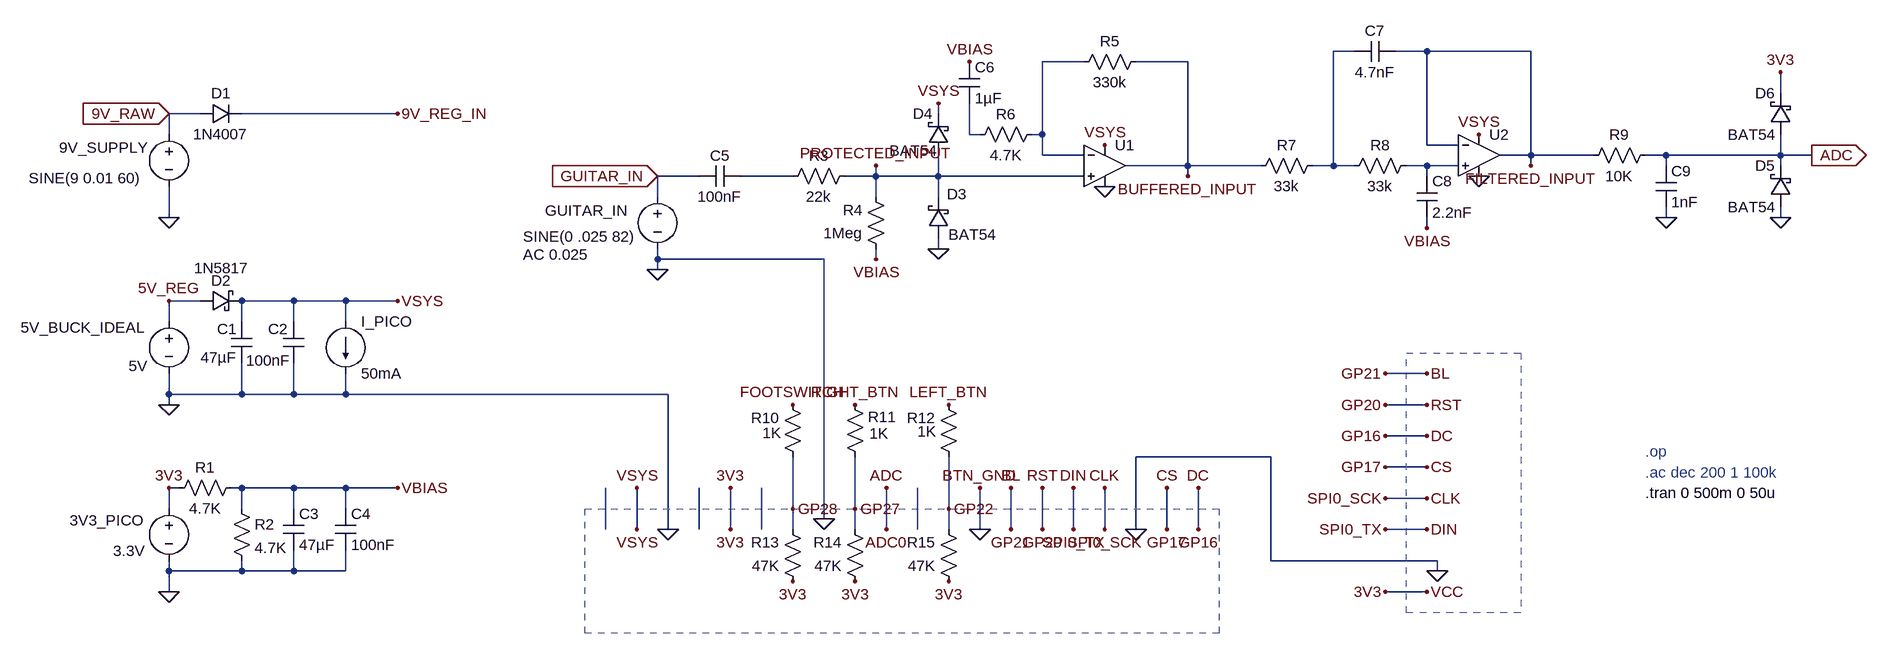
[diagram p0: schematic Tuner_LTspice_Circuit.asc]
Tuner_LTspice_Circuit.asc, the LTspice schematic file:
Version 4
SHEET 1 3036 1332
WIRE 1952 80 1920 80
WIRE 2064 80 2016 80
WIRE 2224 80 2064 80
WIRE 1536 96 1472 96
WIRE 1696 96 1616 96
WIRE 2608 144 2608 112
WIRE 176 176 128 176
WIRE 480 176 240 176
WIRE 1312 176 1312 160
WIRE 128 208 128 176
WIRE 1360 208 1360 160
WIRE 1376 208 1360 208
WIRE 1472 208 1472 96
WIRE 1472 208 1456 208
WIRE 2064 224 2064 80
WIRE 2112 224 2064 224
WIRE 1472 240 1472 208
WIRE 1536 240 1472 240
WIRE 2224 240 2224 80
WIRE 2224 240 2176 240
WIRE 2320 240 2224 240
WIRE 2432 240 2400 240
WIRE 2608 240 2608 208
WIRE 2608 240 2432 240
WIRE 2656 240 2608 240
WIRE 1696 256 1696 96
WIRE 1696 256 1600 256
WIRE 1808 256 1696 256
WIRE 1920 256 1920 80
WIRE 1920 256 1888 256
WIRE 1952 256 1920 256
WIRE 2064 256 2032 256
WIRE 2112 256 2064 256
WIRE 2224 256 2224 240
WIRE 2432 256 2432 240
WIRE 2608 256 2608 240
WIRE 944 272 880 272
WIRE 1088 272 1008 272
WIRE 1216 272 1216 256
WIRE 1216 272 1168 272
WIRE 1312 272 1312 240
WIRE 1312 272 1216 272
WIRE 1536 272 1312 272
WIRE 1696 272 1696 256
WIRE 2064 272 2064 256
WIRE 880 304 880 272
WIRE 1216 304 1216 272
WIRE 1312 304 1312 272
WIRE 128 336 128 288
WIRE 2432 336 2432 320
WIRE 2608 336 2608 320
WIRE 2064 352 2064 336
WIRE 1312 384 1312 368
WIRE 880 400 880 384
WIRE 1136 400 880 400
WIRE 1216 400 1216 384
WIRE 880 416 880 400
WIRE 176 464 128 464
WIRE 320 464 240 464
WIRE 400 464 320 464
WIRE 480 464 400 464
WIRE 128 496 128 464
WIRE 240 496 240 464
WIRE 320 496 320 464
WIRE 400 496 400 464
WIRE 2064 576 2000 576
WIRE 128 608 128 576
WIRE 240 608 240 560
WIRE 240 608 128 608
WIRE 320 608 320 560
WIRE 320 608 240 608
WIRE 400 608 400 576
WIRE 400 608 320 608
WIRE 896 608 400 608
WIRE 128 624 128 608
WIRE 2064 624 2000 624
WIRE 2064 672 2000 672
WIRE 1824 704 1616 704
WIRE 2064 720 2000 720
WIRE 144 752 128 752
WIRE 240 752 224 752
WIRE 320 752 240 752
WIRE 400 752 320 752
WIRE 480 752 400 752
WIRE 2064 768 2000 768
WIRE 128 784 128 752
WIRE 240 784 240 752
WIRE 320 784 320 752
WIRE 400 784 400 752
WIRE 1088 784 1088 704
WIRE 1184 784 1184 704
WIRE 1328 784 1328 704
WIRE 1136 800 1136 400
WIRE 800 816 800 752
WIRE 848 816 848 752
WIRE 896 816 896 608
WIRE 944 816 944 752
WIRE 992 816 992 752
WIRE 1040 816 1040 752
WIRE 1088 816 1088 784
WIRE 1184 816 1184 784
WIRE 1232 816 1232 752
WIRE 1280 816 1280 752
WIRE 1328 816 1328 784
WIRE 1376 816 1376 752
WIRE 1424 816 1424 752
WIRE 1472 816 1472 752
WIRE 1520 816 1520 752
WIRE 1568 816 1568 752
WIRE 1616 816 1616 704
WIRE 1664 816 1664 752
WIRE 1712 816 1712 752
WIRE 2064 816 2000 816
WIRE 1824 864 1824 704
WIRE 2080 864 1824 864
WIRE 128 880 128 864
WIRE 240 880 240 864
WIRE 240 880 128 880
WIRE 320 880 320 848
WIRE 320 880 240 880
WIRE 400 880 400 848
WIRE 400 880 320 880
WIRE 2080 880 2080 864
WIRE 128 912 128 880
WIRE 2064 912 2000 912
FLAG 128 336 0
FLAG 128 176 9V_RAW
IOPIN 128 176 In
FLAG 480 176 9V_REG_IN
FLAG 128 624 0
FLAG 480 464 VSYS
FLAG 128 912 0
FLAG 480 752 VBIAS
FLAG 880 416 0
FLAG 1216 400 VBIAS
FLAG 1568 288 0
FLAG 1568 224 VSYS
FLAG 1216 256 PROTECTED_INPUT
FLAG 2144 272 0
FLAG 2144 208 VSYS
FLAG 2432 336 0
FLAG 2608 336 0
FLAG 2608 112 3V3
FLAG 128 752 3V3
FLAG 2656 240 ADC
IOPIN 2656 240 Out
FLAG 1696 272 BUFFERED_INPUT
FLAG 880 272 GUITAR_IN
IOPIN 880 272 In
FLAG 1360 96 VBIAS
FLAG 2064 352 VBIAS
FLAG 2224 256 FILTERED_INPUT
FLAG 128 464 5V_REG
FLAG 1312 160 VSYS
FLAG 1312 384 0
FLAG 848 816 VSYS
FLAG 896 816 0
FLAG 992 816 3V3
FLAG 1088 784 GP28
FLAG 1136 800 0
FLAG 1184 784 GP27
FLAG 1232 816 ADC0
FLAG 1328 784 GP22
FLAG 1376 816 0
FLAG 1424 816 GP21
FLAG 1472 816 GP20
FLAG 1520 816 SPI0_TX
FLAG 1568 816 SPI0_SCK
FLAG 1616 816 0
FLAG 1664 816 GP17
FLAG 1712 816 GP16
FLAG 848 752 VSYS
FLAG 992 752 3V3
FLAG 1088 624 FOOTSWITCH
FLAG 1184 624 RIGHT_BTN
FLAG 1232 752 ADC
FLAG 1328 624 LEFT_BTN
FLAG 1376 752 BTN_GND
FLAG 2064 912 VCC
FLAG 2080 880 0
FLAG 2064 816 DIN
FLAG 2064 768 CLK
FLAG 2064 720 CS
FLAG 2064 672 DC
FLAG 2064 624 RST
FLAG 2064 576 BL
FLAG 2000 912 3V3
FLAG 1088 896 3V3
FLAG 1184 896 3V3
FLAG 1328 896 3V3
FLAG 2000 768 SPI0_SCK
FLAG 1568 752 CLK
FLAG 2000 816 SPI0_TX
FLAG 1520 752 DIN
FLAG 1472 752 RST
FLAG 2000 624 GP20
FLAG 1712 752 DC
FLAG 2000 672 GP16
FLAG 2000 720 GP17
FLAG 1664 752 CS
FLAG 1424 752 BL
FLAG 2000 576 GP21
SYMBOL voltage 128 192 R0
WINDOW 0 -169 36 Left 2
WINDOW 3 -216 83 Left 2
WINDOW 123 0 0 Left 0
WINDOW 39 0 0 Left 0
SYMATTR InstName 9V_SUPPLY
SYMATTR Value SINE(9 0.01 60)
SYMBOL diode 176 192 R270
WINDOW 0 32 32 VTop 2
WINDOW 3 0 32 VBottom 2
SYMATTR InstName D1
SYMATTR Value 1N4007
SYMBOL voltage 128 480 R0
WINDOW 0 -228 25 Left 2
WINDOW 3 -62 84 Left 2
WINDOW 123 0 0 Left 0
WINDOW 39 0 0 Left 0
SYMATTR InstName 5V_BUCK_IDEAL
SYMATTR Value 5V
SYMBOL schottky 176 480 R270
WINDOW 0 32 32 VTop 2
WINDOW 3 82 33 VBottom 2
SYMATTR InstName D2
SYMATTR Value 1N5817
SYMATTR Description Diode
SYMATTR Type diode
SYMBOL current 400 496 R0
WINDOW 123 0 0 Left 0
WINDOW 39 0 0 Left 0
SYMATTR InstName I_PICO
SYMATTR Value 50mA
SYMBOL voltage 128 768 R0
WINDOW 0 -153 34 Left 2
WINDOW 3 -86 81 Left 2
WINDOW 123 0 0 Left 0
WINDOW 39 0 0 Left 0
SYMATTR InstName 3V3_PICO
SYMATTR Value 3.3V
SYMBOL res 240 736 R90
WINDOW 0 0 56 VBottom 2
WINDOW 3 32 56 VTop 2
SYMATTR InstName R1
SYMATTR Value 4.7K
SYMBOL res 224 768 R0
SYMATTR InstName R2
SYMATTR Value 4.7K
SYMBOL cap 304 784 R0
SYMATTR InstName C3
SYMATTR Value 47µF
SYMBOL cap 384 784 R0
SYMATTR InstName C4
SYMATTR Value 100nF
SYMBOL voltage 880 288 R0
WINDOW 0 -173 37 Left 2
WINDOW 3 -207 77 Left 2
WINDOW 123 -207 105 Left 2
WINDOW 39 0 0 Left 0
SYMATTR InstName GUITAR_IN
SYMATTR Value SINE(0 .025 82)
SYMATTR Value2 AC 0.025
SYMBOL cap 1008 256 R90
WINDOW 0 0 32 VBottom 2
WINDOW 3 32 32 VTop 2
SYMATTR InstName C5
SYMATTR Value 100nF
SYMBOL res 1184 256 R90
WINDOW 0 0 56 VBottom 2
WINDOW 3 32 56 VTop 2
SYMATTR InstName R3
SYMATTR Value 22k
SYMBOL res 1232 400 R180
WINDOW 0 36 76 Left 2
WINDOW 3 36 40 Left 2
SYMATTR InstName R4
SYMATTR Value 1Meg
SYMBOL res 2416 224 R90
WINDOW 0 0 56 VBottom 2
WINDOW 3 32 56 VTop 2
SYMATTR InstName R9
SYMATTR Value 10K
SYMBOL cap 2416 256 R0
SYMATTR InstName C9
SYMATTR Value 1nF
SYMBOL schottky 2624 320 R180
WINDOW 0 24 64 Left 2
WINDOW 3 24 0 Left 2
SYMATTR InstName D5
SYMATTR Value BAT54
SYMATTR Description Diode
SYMATTR Type diode
SYMBOL schottky 2624 208 R180
WINDOW 0 24 64 Left 2
WINDOW 3 24 0 Left 2
SYMATTR InstName D6
SYMATTR Value BAT54
SYMATTR Description Diode
SYMATTR Type diode
SYMBOL res 1632 80 R90
WINDOW 0 0 56 VBottom 2
WINDOW 3 32 56 VTop 2
SYMATTR InstName R5
SYMATTR Value 330k
SYMBOL res 1472 192 R90
WINDOW 0 0 56 VBottom 2
WINDOW 3 32 56 VTop 2
SYMATTR InstName R6
SYMATTR Value 4.7K
SYMBOL cap 2048 272 R0
SYMATTR InstName C8
SYMATTR Value 2.2nF
SYMBOL res 2048 240 R90
WINDOW 0 0 56 VBottom 2
WINDOW 3 32 56 VTop 2
SYMATTR InstName R8
SYMATTR Value 33k
SYMBOL res 1904 240 R90
WINDOW 0 0 56 VBottom 2
WINDOW 3 32 56 VTop 2
SYMATTR InstName R7
SYMATTR Value 33k
SYMBOL cap 2016 64 R90
WINDOW 0 0 32 VBottom 2
WINDOW 3 32 32 VTop 2
SYMATTR InstName C7
SYMATTR Value 4.7nF
SYMBOL OpAmps\\UniversalOpAmp2 1568 256 R0
SYMATTR InstName U1
SYMATTR Value2 Avol=100k GBW=700k Slew=300k
SYMATTR SpiceLine Ilimit=20m Rail=0 Vos=2m
SYMBOL OpAmps\\UniversalOpAmp2 2144 240 R0
SYMATTR InstName U2
SYMATTR Value2 Avol=100k GBW=700k Slew=300k
SYMATTR SpiceLine Ilimit=20m Rail=0 Vos=2m
SYMBOL cap 224 496 R0
WINDOW 0 -22 11 Left 2
WINDOW 3 -47 55 Left 2
SYMATTR InstName C1
SYMATTR Value 47µF
SYMBOL cap 1344 96 R0
SYMATTR InstName C6
SYMATTR Value 1µF
SYMBOL schottky 1328 368 R180
WINDOW 0 -28 68 Left 2
WINDOW 3 -73 6 Left 2
SYMATTR InstName D3
SYMATTR Value BAT54
SYMATTR Description Diode
SYMATTR Type diode
SYMBOL schottky 1328 240 R180
WINDOW 0 24 64 Left 2
WINDOW 3 18 7 Left 2
SYMATTR InstName D4
SYMATTR Value BAT54
SYMATTR Description Diode
SYMATTR Type diode
SYMBOL cap 304 496 R0
WINDOW 0 -23 11 Left 2
WINDOW 3 -57 60 Left 2
SYMATTR InstName C2
SYMATTR Value 100nF
SYMBOL res 1104 720 R180
WINDOW 0 36 76 Left 2
WINDOW 3 33 53 Left 2
SYMATTR InstName R10
SYMATTR Value 1K
SYMBOL res 1168 608 R0
WINDOW 0 36 35 Left 2
WINDOW 3 38 60 Left 2
SYMATTR InstName R11
SYMATTR Value 1K
SYMBOL res 1344 720 R180
WINDOW 0 36 76 Left 2
WINDOW 3 35 55 Left 2
SYMATTR InstName R12
SYMATTR Value 1K
SYMBOL res 1104 912 R180
WINDOW 0 36 76 Left 2
WINDOW 3 36 40 Left 2
SYMATTR InstName R13
SYMATTR Value 47K
SYMBOL res 1200 912 R180
WINDOW 0 36 76 Left 2
WINDOW 3 36 40 Left 2
SYMATTR InstName R14
SYMATTR Value 47K
SYMBOL res 1344 912 R180
WINDOW 0 36 76 Left 2
WINDOW 3 36 40 Left 2
SYMATTR InstName R15
SYMATTR Value 47K
TEXT 2400 696 Left 2 ;.op
TEXT 2400 728 Left 2 ;.ac dec 200 1 100k
TEXT 2400 760 Left 2 !.tran 0 500m 0 50u
RECTANGLE Normal 1744 976 768 784 2
RECTANGLE Normal 2208 944 2032 544 2

The netlist it stands for:
* Tuner_LTspice_Circuit.asc
V§9V_SUPPLY 9V_RAW 0 SINE(9 0.01 60)
D1 9V_RAW 9V_REG_IN 1N4007
V§5V_BUCK_IDEAL 5V_REG 0 5V
D2 5V_REG VSYS 1N5817
I_PICO VSYS 0 50mA
V§3V3_PICO VCC 0 3.3V
R1 VBIAS VCC 4.7K
R2 VBIAS 0 4.7K
C3 VBIAS 0 47µF
C4 VBIAS 0 100nF
V§GUITAR_IN GUITAR_IN 0 SINE(0 .025 82) AC 0.025
C5 N005 GUITAR_IN 100nF
R3 PROTECTED_INPUT N005 22k
R4 VBIAS PROTECTED_INPUT 1Meg
R9 ADC0 FILTERED_INPUT 10K
C9 ADC0 0 1nF
D5 0 ADC0 BAT54
D6 ADC0 VCC BAT54
R5 BUFFERED_INPUT N002 330k
R6 N002 N003 4.7K
C8 N004 VBIAS 2.2nF
R8 N004 N001 33k
R7 N001 BUFFERED_INPUT 33k
C7 FILTERED_INPUT N001 4.7nF
XU1 PROTECTED_INPUT N002 VSYS 0 BUFFERED_INPUT level2 Avol=100k GBW=700k Slew=300k Ilimit=20m Rail=0 Vos=2m En=0 Enk=0 In=0 Ink=0 Rin=500Meg  ; pins In+ In- V+ V- OUT
XU2 N004 FILTERED_INPUT VSYS 0 FILTERED_INPUT level2 Avol=100k GBW=700k Slew=300k Ilimit=20m Rail=0 Vos=2m En=0 Enk=0 In=0 Ink=0 Rin=500Meg  ; pins In+ In- V+ V- OUT
C1 VSYS 0 47µF
C6 VBIAS N003 1µF
D3 0 PROTECTED_INPUT BAT54
D4 PROTECTED_INPUT VSYS BAT54
C2 VSYS 0 100nF
R10 GP28 FOOTSWITCH 1K
R11 RIGHT_BTN GP27 1K
R12 GP22 LEFT_BTN 1K
R13 VCC GP28 47K
R14 VCC GP27 47K
R15 VCC GP22 47K
.model D D
.lib standard.dio
* .op
* .ac dec 200 1 100k
.tran 0 500m 0 50u
.lib UniversalOpAmp2.lib
.backanno
.end